# Altium project OFP_MCM_v1.6.3.PrjPcb (part 3 of 7)
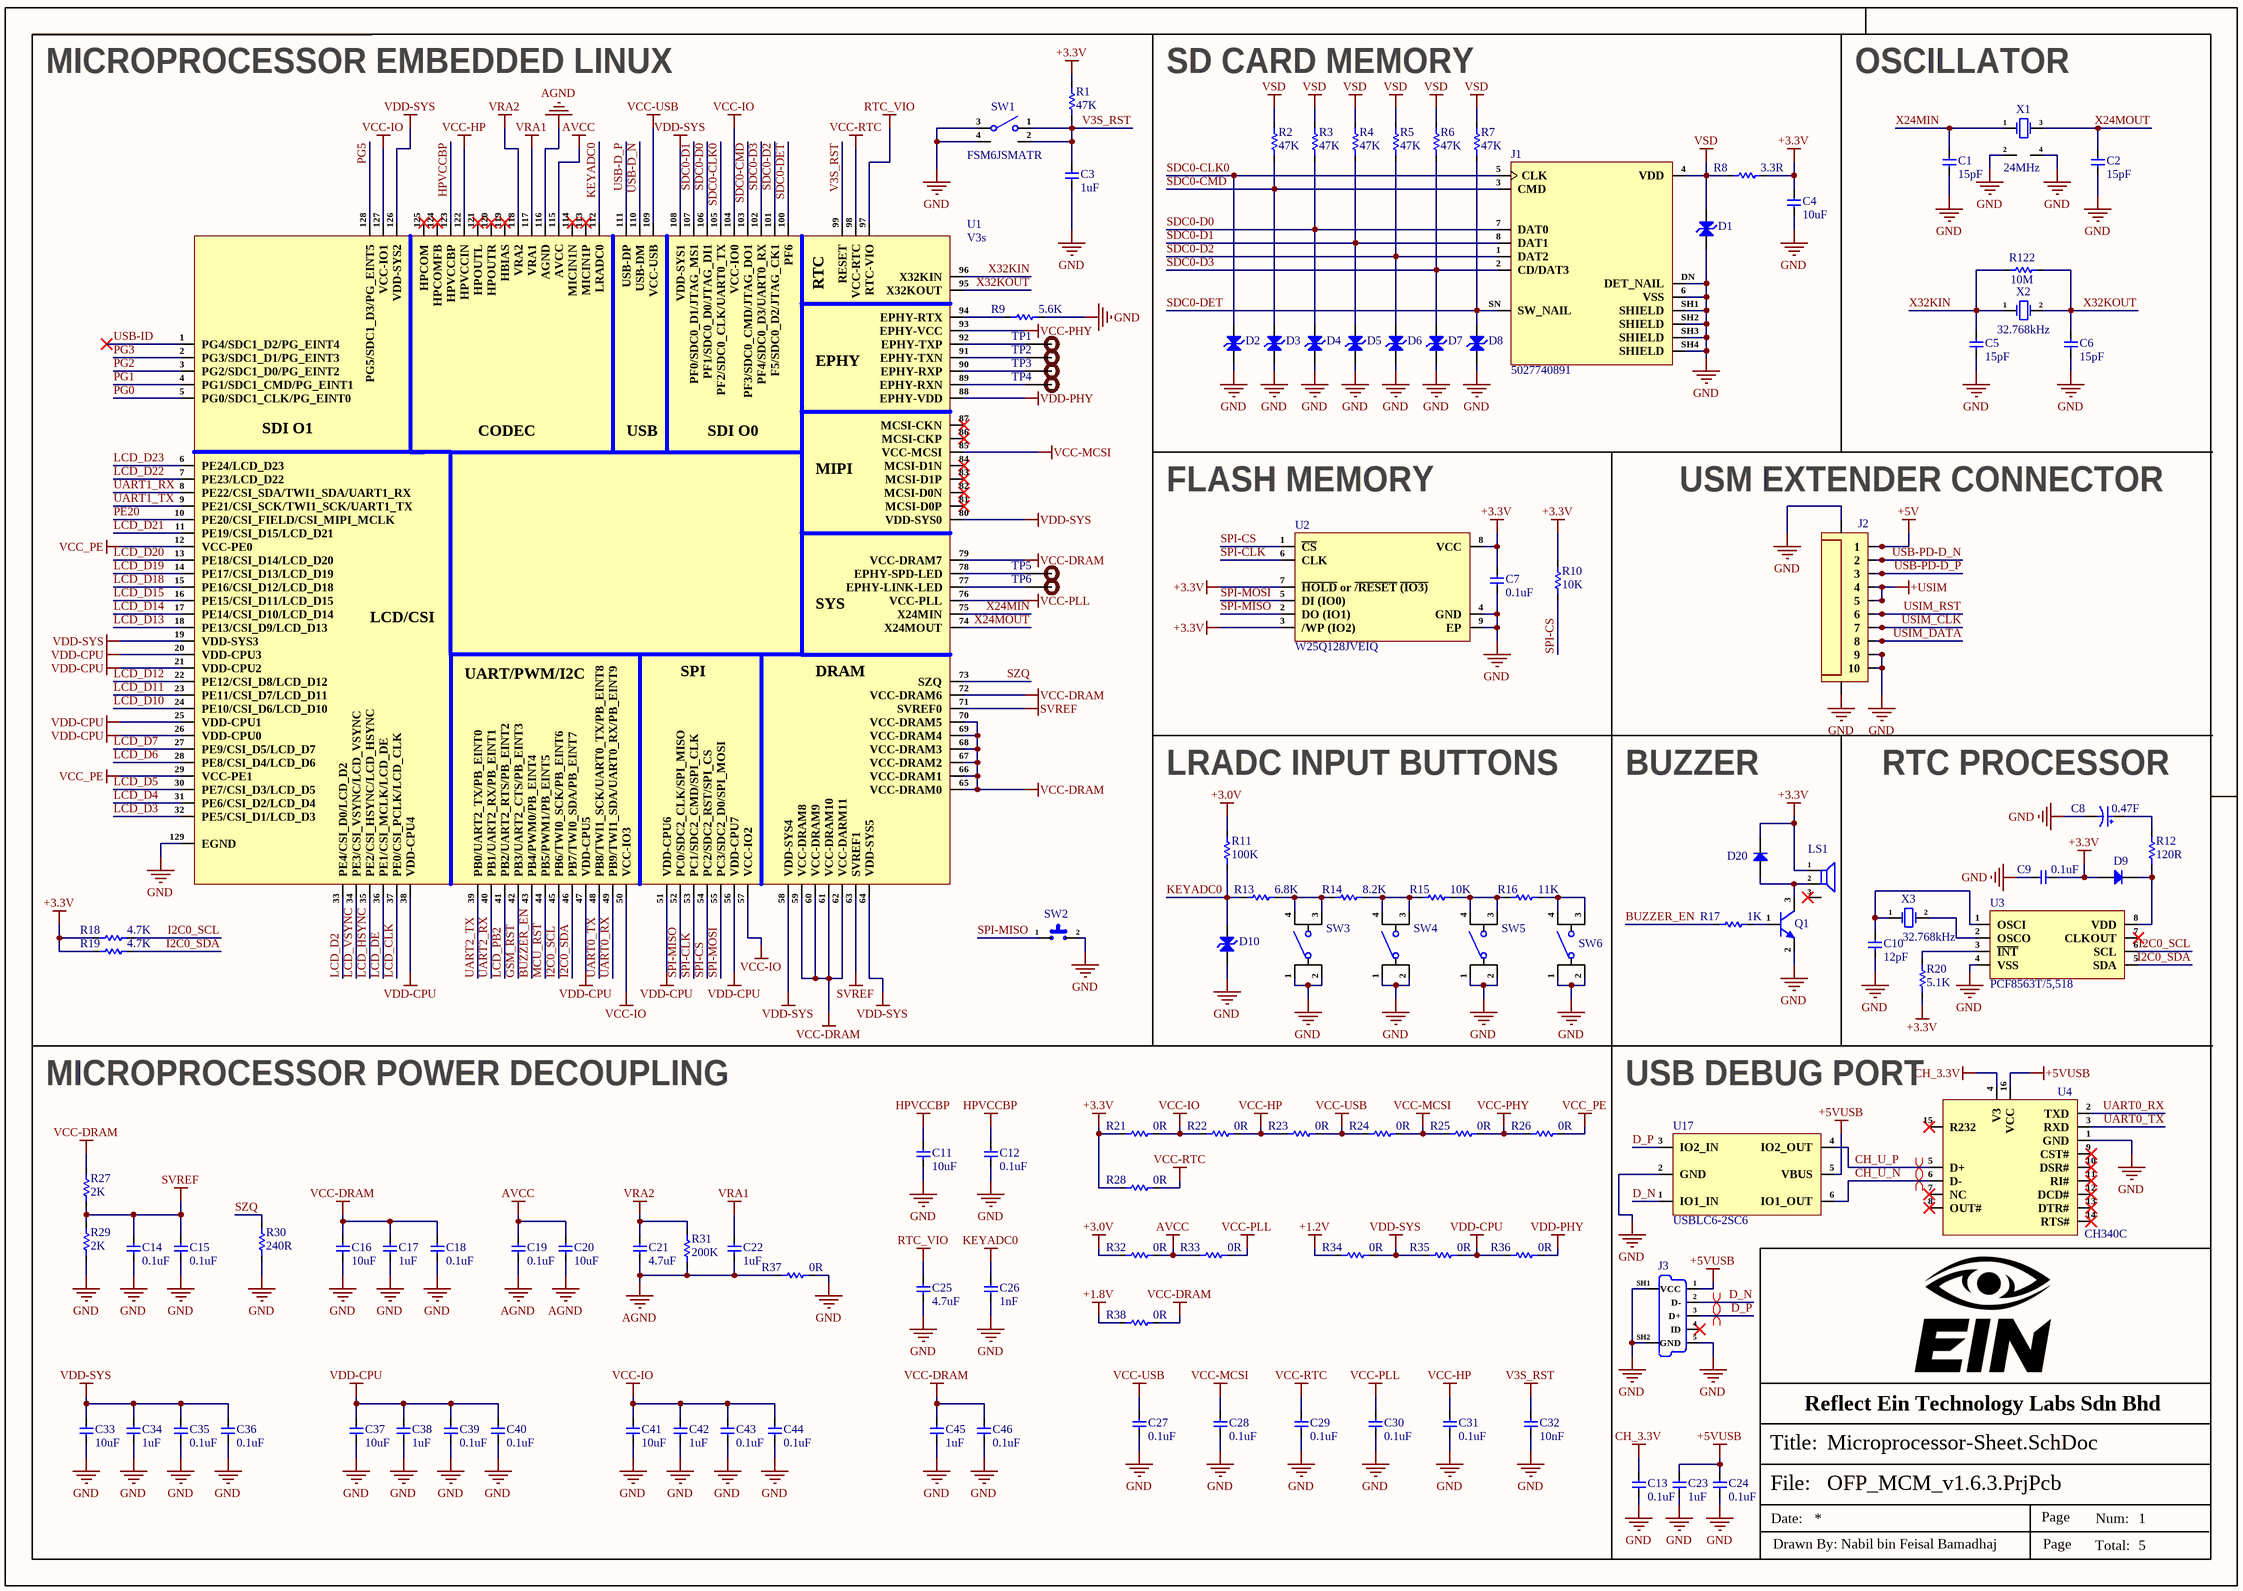
[diagram p6: Microprocessor-Sheet.SchDoc]

## Sheet Microprocessor-Sheet.SchDoc (continued)

### Library data of the parts (continued)
R27 R29 = RC0402FR-072KL: RES 2K OHM 1% 1/16W 0402; Manufacturer: Yageo; Item Type: Resistor; Value: 2kR; Power Rating: 63mW; Voltage Rating: 50V; Temperature Coefficient: 100ppm/°C; LCSC Part Number: C60488; ComponentLink2URL: https://datasheet.ciiva.com/11808/0900766b80c66297-11808787.pdf?src-supplier=Rs; ComponentLink2Description: https://datasheet.ciiva.com/11808/0900766b80c66297-11808787.pdf?src-supplier=Rs; ComponentLink3URL: https://datasheet.ciiva.com/7849/1018594-7849934.pdf?src-supplier=Element14; ComponentLink3Description: https://datasheet.ciiva.com/7849/1018594-7849934.pdf?src-supplier=Element14; ComponentLink4URL: https://datasheet.ciiva.com/7849/1018594-7849935.pdf?src-supplier=Element14; ComponentLink4Description: https://datasheet.ciiva.com/7849/1018594-7849935.pdf?src-supplier=Element14; ComponentLink5URL: https://datasheet.ciiva.com/7983/1018594-7983517.pdf?src-supplier=Element14; ComponentLink5Description: https://datasheet.ciiva.com/7983/1018594-7983517.pdf?src-supplier=Element14; ComponentLink6URL: https://datasheet.ciiva.com/2453/pyu-r-int-thick-7-2453635.pdf?src-supplier=Digi-Key; ComponentLink6Description: https://datasheet.ciiva.com/2453/pyu-r-int-thick-7-2453635.pdf?src-supplier=Digi-Key; ComponentLink7URL: https://datasheet.ciiva.com/2453/pyu-r-int-thick-7-2453636.pdf?src-supplier=Digi-Key; ComponentLink7Description: https://datasheet.ciiva.com/2453/pyu-r-int-thick-7-2453636.pdf?src-supplier=Digi-Key; ComponentLink8URL: https://datasheet.ciiva.com/2453/pyu-r-int-thick-7-2453634.pdf?src-supplier=Digi-Key; ComponentLink8Description: https://datasheet.ciiva.com/2453/pyu-r-int-thick-7-2453634.pdf?src-supplier=Digi-Key; ComponentLink9URL: https://datasheet.ciiva.com/12667/pyu-rc0402-51-rohs-l-6-r-12667451.pdf?src-supplier=Mouser; ComponentLink9Description: https://datasheet.ciiva.com/12667/pyu-rc0402-51-rohs-l-6-r-12667451.pdf?src-supplier=Mouser; ComponentLink10URL: https://datasheet.ciiva.com/15189/getdatasheetpartid-358921-15189414.pdf?src-supplier=Verical; ComponentLink10Description: https://datasheet.ciiva.com/15189/getdatasheetpartid-358921-15189414.pdf?src-supplier=Verical; Supplier: Future Electronics; Supplier Part Number: 7970452; Manufacturer Part Number: RC0402FR-072KL; RoHS: Yes; Category: Chip SMD Resistors; Stock: 8530000; Pricing: 10000=0.0018, 100000=0.0011, 200000=0.0017, 300000=0.001, 750000=0.0016, 2000000=0.0009, 2500000=0.0016, 10000000=0.0014 (USD); Case/Package: 0402; Case Code (Metric): 1005; Case Code (Imperial): 0402; Min Operating Temperature: -55°C; Max Operating Temperature: 155°C; Resistor Type: Thick Film; Tolerance: 1%; Package Quantity: 1; Packaging: Tape and Reel; Number of Terminations: 2; Termination: SMD/SMT; Max Power Dissipation: 63mW; Working Voltage: 50V; Features: Moisture Resistant; Series: RC; Technology: THICK FILM; Construction: Rectangular; Resistance Tolerance: 1%; Voltage Rating (DC): 50V; Length: 0.039inch; Width: 0.02inch; Height: 0.016inch; Depth: 0.5mm; RoHS Compliant: Yes; Military Standard: Not; Reach SVHC Compliant: Unknown; Lead Free: 5697LeadFree; ComponentLink1URL: https://datasheet.ciiva.com/11808/0900766b80c66297-11808787.pdf?src-supplier=Rs; ComponentLink1Description: https://datasheet.ciiva.com/11808/0900766b80c66297-11808787.pdf?src-supplier=Rs; ComponentLink11URL: https://datasheet.ciiva.com/2453/pyu-r-int-thick-7-2453635.pdf?src-supplier=Digikey; ComponentLink11Description: https://datasheet.ciiva.com/2453/pyu-r-int-thick-7-2453635.pdf?src-supplier=Digikey; ComponentLink12URL: https://datasheet.ciiva.com/2453/pyu-r-int-thick-7-2453636.pdf?src-supplier=Digikey; ComponentLink12Description: https://datasheet.ciiva.com/2453/pyu-r-int-thick-7-2453636.pdf?src-supplier=Digikey; ComponentLink13URL: https://datasheet.ciiva.com/2453/pyu-r-int-thick-7-2453634.pdf?src-supplier=Digikey; ComponentLink13Description: https://datasheet.ciiva.com/2453/pyu-r-int-thick-7-2453634.pdf?src-supplier=Digikey
R30 = RC0402FR-07240RL: RES 240 OHM 1% 1/16W 0402; Manufacturer: Yageo; Item Type: Resistors; Power Rating: 63mW; Temperature Coefficient: 100ppm/°C; Voltage Rating (DC): 50V; Supplier 1: Mouser; Manufacturer Part Number: RC0402FR-07240RL; RoHS: Yes; Stock 1: 1903202; Pricing 1: 1=0.10000, 10=0.01200, 50=0.01200, 100=0.00500, 1000=0.00300, 10000=0.00100 (USD); Case/Package: 0402; Case Code (Metric): 1005; Case Code (Imperial): 0402; Size Code: 0402; Min Operating Temperature: -55°C; Max Operating Temperature: 155°C; Resistance: 240R; Tolerance: 1%; Packaging: Tape and Reel; Resistor Type: Thick Film; Voltage Rating: 50V; Package Quantity: 1; Number of Terminations: 2; Termination: SMD/SMT; Max Power Dissipation: 63mW; Features: Moisture Resistant; Series: RC; Construction: Rectangular; Resistance Tolerance: 1%; Length: 1mm; Width: 0.02inch; Height: 0.016inch; Depth: 0.5mm; REACH SVHC: Unknown; Lead Free: Lead Free; RoHS Compliant: Yes; Military Standard: Not; ComponentLink1URL: https://datasheet.ciiva.com/7849/1018594-7849915.pdf?src-supplier=Element14; ComponentLink1Description: https://datasheet.ciiva.com/7849/1018594-7849915.pdf?src-supplier=Element14; ComponentLink2URL: https://datasheet.ciiva.com/7849/1018594-7849916.pdf?src-supplier=Element14; ComponentLink2Description: https://datasheet.ciiva.com/7849/1018594-7849916.pdf?src-supplier=Element14; ComponentLink3URL: https://datasheet.ciiva.com/2519/pyu-r-int-thick-7-2519157.pdf?src-supplier=Digi-Key; ComponentLink3Description: https://datasheet.ciiva.com/2519/pyu-r-int-thick-7-2519157.pdf?src-supplier=Digi-Key; ComponentLink4URL: https://datasheet.ciiva.com/2519/pyu-r-int-thick-7-2519158.pdf?src-supplier=Digi-Key; ComponentLink4Description: https://datasheet.ciiva.com/2519/pyu-r-int-thick-7-2519158.pdf?src-supplier=Digi-Key; ComponentLink5URL: https://datasheet.ciiva.com/2519/pyu-r-int-thick-7-2519156.pdf?src-supplier=Digi-Key; ComponentLink5Description: https://datasheet.ciiva.com/2519/pyu-r-int-thick-7-2519156.pdf?src-supplier=Digi-Key; ComponentLink6URL: https://datasheet.ciiva.com/12669/pyu-rc0402-51-rohs-l-6-r-12669689.pdf?src-supplier=Mouser; ComponentLink6Description: https://datasheet.ciiva.com/12669/pyu-rc0402-51-rohs-l-6-r-12669689.pdf?src-supplier=Mouser; ComponentLink7URL: https://datasheet.ciiva.com/17419/pyu-rc0402-51-rohs-l-6-r-17419482.pdf?src-supplier=Future+Electronics; ComponentLink7Description: https://datasheet.ciiva.com/17419/pyu-rc0402-51-rohs-l-6-r-17419482.pdf?src-supplier=Future+Electronics; Supplier Part Number 1: 603-RC0402FR-07240RL; LCSC Part Number: C114755
R31 = RC0402FR-07200KL: RES 200K OHM 1% 1/16W 0402; Manufacturer: Yageo; Item Type: Resistor; Power Rating: 63mW; Temperature Coefficient: 100ppm/°C; Value: 200kR; Voltage Rating: 50V; Supplier: Future Electronics; LCSC Part Number: C114763; Manufacturer Part Number: RC0402FR-07200KL; RoHS: Yes; Stock: 290000; Pricing: 10000=0.0004, 50000=0.0008, 150000=0.0004, 300000=0.0007, 400000=0.0004, 1000000=0.0004, 2500000=0.0004, 3000000=0.0006 (USD); Case/Package: 0402; Case Code (Metric): 1005; Case Code (Imperial): 0402; Min Operating Temperature: -55°C; Max Operating Temperature: 155°C; Tolerance: 1%; Packaging: Tape and Reel; Termination: SMD/SMT; Series: RC; Technology: THICK FILM; Package Quantity: 1; Resistor Type: Thick Film; Number of Terminations: 2; Max Power Dissipation: 63mW; Working Voltage: 50V; Features: Moisture Resistant; Construction: Rectangular; Resistance Tolerance: 1%; Voltage Rating (DC): 50V; Length: 0.039inch; Width: 0.02inch; Height: 0.016inch; Depth: 0.5mm; RoHS Compliant: Yes; Lead Free: 5697LeadFree; Military Standard: Not; Reach SVHC Compliant: Unknown; ComponentLink1URL: https://datasheet.ciiva.com/7849/1018594-7849897.pdf?src-supplier=Element14; ComponentLink1Description: https://datasheet.ciiva.com/7849/1018594-7849897.pdf?src-supplier=Element14; ComponentLink2URL: https://datasheet.ciiva.com/7849/1018594-7849896.pdf?src-supplier=Element14; ComponentLink2Description: https://datasheet.ciiva.com/7849/1018594-7849896.pdf?src-supplier=Element14; ComponentLink3URL: https://datasheet.ciiva.com/46394/1018594-46394953.pdf?src-supplier=Element14; ComponentLink3Description: https://datasheet.ciiva.com/46394/1018594-46394953.pdf?src-supplier=Element14; ComponentLink4URL: https://datasheet.ciiva.com/2453/pyu-r-int-thick-7-2453557.pdf?src-supplier=Digikey; ComponentLink4Description: https://datasheet.ciiva.com/2453/pyu-r-int-thick-7-2453557.pdf?src-supplier=Digikey; ComponentLink5URL: https://datasheet.ciiva.com/2453/pyu-r-int-thick-7-2453558.pdf?src-supplier=Digikey; ComponentLink5Description: https://datasheet.ciiva.com/2453/pyu-r-int-thick-7-2453558.pdf?src-supplier=Digikey; ComponentLink6URL: https://datasheet.ciiva.com/2453/pyu-r-int-thick-7-2453556.pdf?src-supplier=Digikey; ComponentLink6Description: https://datasheet.ciiva.com/2453/pyu-r-int-thick-7-2453556.pdf?src-supplier=Digikey; ComponentLink7URL: https://datasheet.ciiva.com/12667/pyu-rc0402-51-rohs-l-6-r-12667911.pdf?src-supplier=Mouser; ComponentLink7Description: https://datasheet.ciiva.com/12667/pyu-rc0402-51-rohs-l-6-r-12667911.pdf?src-supplier=Mouser; ComponentLink8URL: https://datasheet.ciiva.com/15189/getdatasheetpartid-323720-15189381.pdf?src-supplier=Verical; ComponentLink8Description: https://datasheet.ciiva.com/15189/getdatasheetpartid-323720-15189381.pdf?src-supplier=Verical; ComponentLink9URL: https://datasheet.ciiva.com/16740/pyu-rc0402-51-rohs-l-6-r-16740636.pdf?src-supplier=Future+Electronics; ComponentLink9Description: https://datasheet.ciiva.com/16740/pyu-rc0402-51-rohs-l-6-r-16740636.pdf?src-supplier=Future+Electronics
R122 = RC0402JR-0710ML: RES SMD 10M Ohm 5% 1/16W 0402; Manufacturer: Yageo; Resistance: 10MR; Power Rating: 62.5mW; Voltage Rating: 50V; Temperature Coefficient: 100ppm/°C; Max Power Dissipation: 63mW; Supplier 1: Digi-Key; Manufacturer Part Number: RC0402JR-0710ML; RoHS: Yes; Category: Chip SMD Resistors; Stock 1: 38636; Pricing 1: 1=0.10000, 10=0.01300, 100=0.00540, 1000=0.00244, 2500=0.00212, 5000=0.00175 (USD); Case/Package: 0402; Number of Pins: 2; Case Code (Metric): 1005; Case Code (Imperial): 0402; Weight: 2.3E-05oz; Size Code: 0402; Min Operating Temperature: -55°C; Max Operating Temperature: 155°C; Tolerance: 5%; Package Quantity: 1; Packaging: Tape and Reel; Resistor Type: Thick Film; Number of Terminations: 2; Termination: SMD/SMT; Voltage Rating (DC): 50V; Features: Moisture Resistant; Series: RC; Construction: Rectangular; Resistance Tolerance: 5%; Length: 1mm; Width: 0.02inch; Height: 0.016inch; Depth: 0.5mm; RoHS Compliant: Yes; REACH SVHC: No SVHC; Military Standard: Not; Lead Free: Lead Free; ComponentLink1URL: https://datasheet.ciiva.com/7983/1018594-7983541.pdf?src-supplier=Element14; ComponentLink1Description: https://datasheet.ciiva.com/7983/1018594-7983541.pdf?src-supplier=Element14; ComponentLink2URL: https://datasheet.ciiva.com/2518/pyu-r-int-thick-7-2518904.pdf?src-supplier=Digi-Key; ComponentLink2Description: https://datasheet.ciiva.com/2518/pyu-r-int-thick-7-2518904.pdf?src-supplier=Digi-Key; ComponentLink3URL: https://datasheet.ciiva.com/2518/pyu-r-int-thick-7-2518905.pdf?src-supplier=Digi-Key; ComponentLink3Description: https://datasheet.ciiva.com/2518/pyu-r-int-thick-7-2518905.pdf?src-supplier=Digi-Key; ComponentLink4URL: https://datasheet.ciiva.com/2518/pyu-r-int-thick-7-2518906.pdf?src-supplier=Digi-Key; ComponentLink4Description: https://datasheet.ciiva.com/2518/pyu-r-int-thick-7-2518906.pdf?src-supplier=Digi-Key; ComponentLink5URL: https://datasheet.ciiva.com/12577/pyu-rc0402-51-rohs-l-6-r-12577774.pdf?src-supplier=Mouser; ComponentLink5Description: https://datasheet.ciiva.com/12577/pyu-rc0402-51-rohs-l-6-r-12577774.pdf?src-supplier=Mouser; Supplier Part Number 1: 311-10MJRCT-ND; LCSC Part Number: C274900
SW1 = FSM6JSMATR: SWITCH TACTILE SPST-NO 0.05A 24V; Manufacturer: TE Connectivity Alcoswitch; Item Type: Switches; Number of Positions: 2NUMBER; Supplier: Rs; LCSC Part Number: C6558197; Manufacturer Part Number: FSM6JSMATR; RoHS: Yes; Stock: 735; RoHS Compliant: 5897YesNo; ComponentLink1URL: https://datasheet.ciiva.com/7097/1486952-7097325.pdf?src-supplier=Newark; ComponentLink1Description: https://datasheet.ciiva.com/7097/1486952-7097325.pdf?src-supplier=Newark; ComponentLink2URL: https://datasheet.ciiva.com/1530/1714712-1530976.pdf?src-supplier=Element14; ComponentLink2Description: https://datasheet.ciiva.com/1530/1714712-1530976.pdf?src-supplier=Element14; ComponentLink3URL: https://datasheet.ciiva.com/15184/getdatasheetpartid-167889-15184443.pdf?src-supplier=Verical; ComponentLink3Description: https://datasheet.ciiva.com/15184/getdatasheetpartid-167889-15184443.pdf?src-supplier=Verical; ComponentLink4URL: https://datasheet.ciiva.com/8082/eng-cs-1308111-1-switches-core-program-catalog-0308-8082682.pdf?src-supplier=Avnet; ComponentLink4Description: https://datasheet.ciiva.com/8082/eng-cs-1308111-1-switches-core-program-catalog-0308-8082682.pdf?src-supplier=Avnet
SW2 = TS-1088-AR02016: Without bracket 50mA 4mm 100000 Times 12V 160gf 3mm 2mm Round Button Standing paste SPST SMD Tactile Switches ROHS; Manufacturer: XUNPU; Manufacturer Part Number: TS-1088-AR02016; Package: SMD; LCSC Part Number: C720477; Item Type: Tactile Switch; ComponentLink1Description: LCSC; ComponentLink1URL: https://www.lcsc.com/product-detail/Tactile-Switches_XUNPU-TS-1088-AR02016_C720477.html?s_z=n_TS-1088-AR02016
SW3-SW6 = TS-1002S-12026C: 6mm 12mm Round Button 50mA Standing paste 6mm SPST 12V SMD,6x6mm Tactile Switches ROHS; Manufacturer: XUNPU; Manufacturer Part Number: TS-1002S-12026C; Package: SMD,6x6mm; LCSC Part Number: C455124; Item Type: Tactile Switch; ComponentLink1Description: LCSC; ComponentLink1URL: https://www.lcsc.com/product-detail/Tactile-Switches_XUNPU-TS-1002S-12026C_C455124.html?s_z=n_TS-1002S-12026C
TP1-TP6 = TEST POINT 0.5mm Dia: Test Point ON; Item Type: Test Point; Manufacturer Part Number: TEST POINT 0.5mm Dia
U1 = V3s: LQFP-128-EP(14x14) Microcontrollers (MCU/MPU/SOC) ROHS; Manufacturer: Allwinner Tech; Item Type: IC; Manufacturer Part Number: V3s; Package: LQFP-128-EP(14x14); LCSC Part Number: C2687449; ComponentLink1Description: LCSC; ComponentLink1URL: https://www.lcsc.com/product-detail/Microcontrollers-MCU-MPU-SOC_Allwinner-Tech-V3s_C2687449.html?s_z=n_V3s
U2 = W25Q128JVEIQ: IC FLASH 128MBIT SPI/QUAD 8WSON; Manufacturer: Winbond; Memory Format: Non-Volatile,FLASH; Memory Size: 128Mb; Frequency: 133MHz; Supplier: Digikey; LCSC Part Number: C401662; Manufacturer Part Number: W25Q128JVEIQ; RoHS: Yes; Item Type: IC; Stock: 12733; Pricing: 1=1.92, 10=1.701, 25=1.6224, 63=1.54651, 126=1.49183, 252=1.43909, 504=1.38821, 1008=1.33908, 5040=1.23141 (USD); Mounting Technology: Surface Mount; Min Operating Temperature: -40°C; Max Operating Temperature: 85°C; Packaging: Rail/Tube; Series: SpiFlash®; RoHS Compliant: Yes; ComponentLink1URL: http://www.winbond.com/resource-files/w25q128jv%20revf%2003272018%20plus.pdf?src-supplier=Digikey; ComponentLink1Description: http://www.winbond.com/resource-files/w25q128jv%20revf%2003272018%20plus.pdf?src-supplier=Digikey
U3 = PCF8563T/5,518: IC RTC CLOCK/CALENDAR I2C 8SO; Manufacturer: NXP Semiconductors; Supplier: Arrow Electronics; LCSC Part Number: C7440; Manufacturer Part Number: PCF8563T/5,518; RoHS: Yes; Item Type: IC; Stock: 812; Pricing: 1=0.8372, 10=0.6546, 100=0.5322, 500=0.5102, 1000=0.4872, 2500=0.4562, 5000=0.4356, 10000=0.4016, 25000=0.3863 (USD); ComponentLink1URL: https://datasheet.ciiva.com/8145/pcf8563-8145180.pdf?src-supplier=Avnet; ComponentLink1Description: https://datasheet.ciiva.com/8145/pcf8563-8145180.pdf?src-supplier=Avnet; ComponentLink2URL: https://datasheet.ciiva.com/1238/pcf8563-1238727.pdf?src-supplier=Digikey; ComponentLink2Description: https://datasheet.ciiva.com/1238/pcf8563-1238727.pdf?src-supplier=Digikey; ComponentLink3URL: https://datasheet.ciiva.com/1238/pcf8563-1238728.pdf?src-supplier=Digikey; ComponentLink3Description: https://datasheet.ciiva.com/1238/pcf8563-1238728.pdf?src-supplier=Digikey; ComponentLink4URL: https://datasheet.ciiva.com/1238/pcf8563-1238773.pdf?src-supplier=Digikey; ComponentLink4Description: https://datasheet.ciiva.com/1238/pcf8563-1238773.pdf?src-supplier=Digikey; ComponentLink5URL: https://datasheet.ciiva.com/16287/pcf8563-16287110.pdf?src-supplier=Future+Electronics; ComponentLink5Description: https://datasheet.ciiva.com/16287/pcf8563-16287110.pdf?src-supplier=Future+Electronics
U4 = CH340C: 2Mbps Transceiver USB 2.0 SOP-16 USB ICs ROHS; Manufacturer: WCH; Item Type: IC; Manufacturer Part Number: CH340C; Package: SOP-16; LCSC Part Number: C84681; ComponentLink1Description: LCSC; ComponentLink1URL: https://www.lcsc.com/product-detail/USB-ICs_WCH-Jiangsu-Qin-Heng-CH340C_C84681.html
U17 = USBLC6-2SC6: 6A 12V 150W 6V Unidirectional 5V SOT-23-6 ESD and Surge Protection (TVS/ESD) ROHS; Manufacturer: TECH PUBLIC; Manufacturer Part Number: USBLC6-2SC6; Package: SOT-23-6; LCSC Part Number: C2827654; Item Type: (TVS/ESD); ComponentLink1Description: LCSC; ComponentLink1URL: https://www.lcsc.com/product-detail/ESD-and-Surge-Protection-TVS-ESD_TECH-PUBLIC-USBLC6-2SC6_C2827654.html
X1 = 7M24000192: 24MHz Surface Mount Crystal 12pF ±10ppm ±10ppm SMD3225-4P Crystals ROHS; Manufacturer: TXC Corp; Item Type: Crytal; Manufacturer Part Number: 7M24000192; Package: SMD3225-4P; LCSC Part Number: C331579; ComponentLink1Description: LCSC; ComponentLink1URL: https://www.lcsc.com/product-detail/Crystals_TXC-Corp-7M24000192_C331579.html
X2 X3 = CM315D32768DZFT: CRYSTAL 32.7680KHZ 12.5PF SMD; Manufacturer: Citizen; Item Type: Crystals; Supplier: Digikey; LCSC Part Number: C182057; Manufacturer Part Number: CM315D32768DZFT; RoHS: Yes; Stock: 343217; Pricing: 1=0.5, 10=0.432, 50=0.3892, 100=0.3723, 500=0.3358, 1000=0.32128 (USD); Lead Free: 5697LeadFree; ComponentLink1URL: https://datasheet.ciiva.com/16437/cm315-16437047.pdf?src-supplier=Future+Electronics; ComponentLink1Description: https://datasheet.ciiva.com/16437/cm315-16437047.pdf?src-supplier=Future+Electronics

## Sheet Power-Sheet.SchDoc
size 420 x 297 mm; SheetNumber: 2; SheetTotal: 5
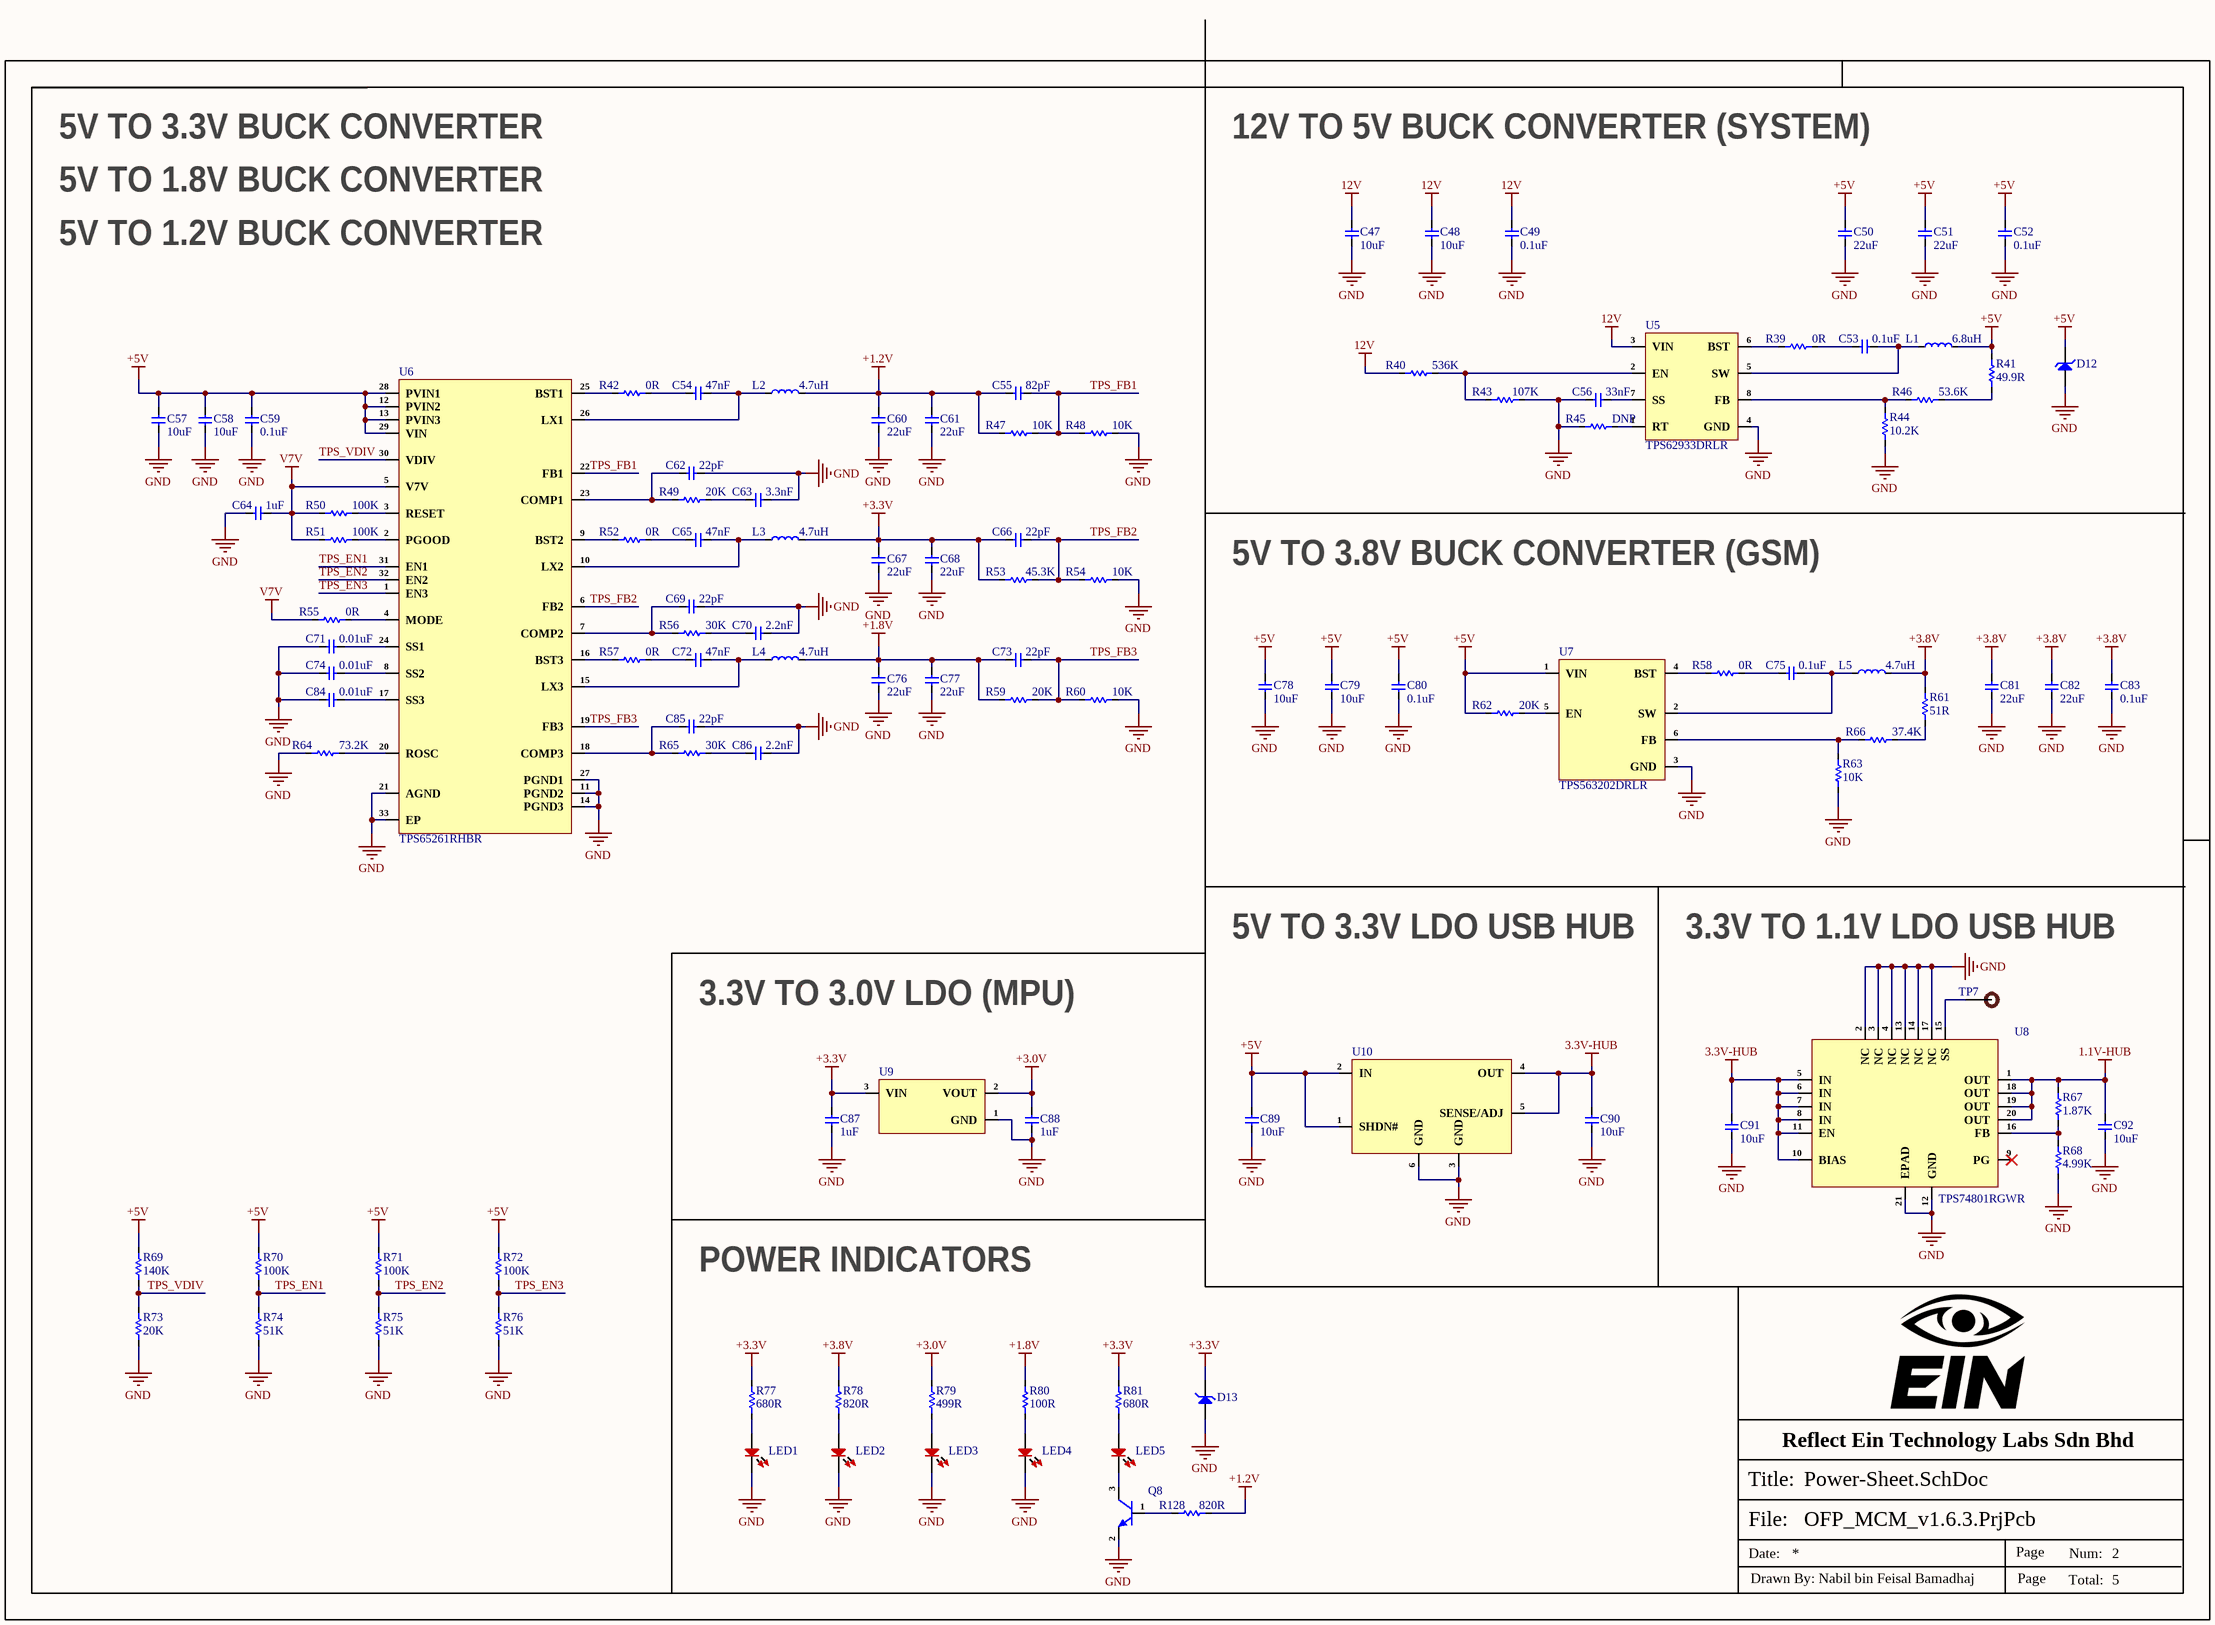
[diagram p1: Power-Sheet.SchDoc]

### Parts
C47  10uF  [Cap-1210]
C48  10uF  [Cap-1210]
C49  0.1uF  [Cap-0603]
C50  22uF  [Cap-0805]
C51  22uF  [Cap-0805]
C52  0.1uF  [Cap-0603]
C53  0.1uF  [Cap-0603]
C54  47nF  [Cap-0603]
C55  82pF  [Cap-0603]
C56  33nF  [Cap-0603]
C57  10uF  [Cap-0603]
C58  10uF  [Cap-0603]
C59  0.1uF  [Cap-0603]
C60  22uF  [Cap-0805]
C61  22uF  [Cap-0805]
C62  22pF  [Cap-0603]
C63  3.3nF  [Cap-0603]
C64  1uF  [Cap-0603]
C65  47nF  [Cap-0603]
C66  22pF  [Cap-0603]
C67  22uF  [Cap-0805]
C68  22uF  [Cap-0805]
C69  22pF  [Cap-0603]
C70  2.2nF  [Cap-0603]
C71  0.01uF  [Cap-0603]
C72  47nF  [Cap-0603]
C73  22pF  [Cap-0603]
C74  0.01uF  [Cap-0603]
C75  0.1uF  [Cap-0603]
C76  22uF  [Cap-0805]
C77  22uF  [Cap-0805]
C78  10uF  [Cap-1210]
C79  10uF  [Cap-1210]
C80  0.1uF  [Cap-0603]
C81  22uF  [Cap-0805]
C82  22uF  [Cap-0805]
C83  0.1uF  [Cap-0603]
C84  0.01uF  [Cap-0603]
C85  22pF  [Cap-0603]
C86  2.2nF  [Cap-0603]
C87  1uF  [Cap-0402]
C88  1uF  [Cap-0402]
C89  10uF  [Cap-1210]
C90  10uF  [Cap-1210]
C91  10uF  [Cap-1210]
C92  10uF  [Cap-1210]
D12  SMBJ5.0A  [SMB_]  (value not drawn)
D13  MSP3V3HM3/89A  [MicroSMP]  (value not drawn)
L1  6.8uH  [ETQP3M6R8KVN]
L2  4.7uH  [YSPI0518S-4R7M]
L3  4.7uH  [YSPI0518S-4R7M]
L4  4.7uH  [YSPI0518S-4R7M]
L5  4.7uH  [SRN4018-4R7M]
LED1  RED  [TH LED 5mm_]  (value not drawn)
LED2  RED  [LED-0603]  (value not drawn)
LED3  RED  [LED-0603]  (value not drawn)
LED4  RED  [LED-0603]  (value not drawn)
LED5  RED  [LED-0603]  (value not drawn)
Q8  MMBT3904  [SOT-23]  (value not drawn)
R39  0R  [Res-0603]
R40  536K  [Res-0603]
R41  49.9R  [Res-0603]
R42  0R  [Res-0603]
R43  107K  [Res-0603]
R44  10.2K  [Res-0603]
R45  DNP  [Res-0603]
R46  53.6K  [Res-0603]
R47  10K  [Res-0603]
R48  10K  [Res-0603]
R49  20K  [Res-0603]
R50  100K  [Res-0603]
R51  100K  [Res-0603]
R52  0R  [Res-0603]
R53  45.3K  [Res-0603]
R54  10K  [Res-0603]
R55  0R  [Res-0603]
R56  30K  [Res-0603]
R57  0R  [Res-0603]
R58  0R  [Res-0603]
R59  20K  [Res-0603]
R60  10K  [Res-0603]
R61  51R  [Res-0603]
R62  20K  [Res-0603]
R63  10K  [Res-0603]
R64  73.2K  [Res-0603]
R65  30K  [Res-0603]
R66  37.4K  [Res-0603]
R67  1.87K  [Res-0402]
R68  4.99K  [Res-0402]
R69  140K  [Res-0603]
R70  100K  [Res-0603]
R71  100K  [Res-0603]
R72  100K  [Res-0603]
R73  20K  [Res-0603]
R74  51K  [Res-0603]
R75  51K  [Res-0603]
R76  51K  [Res-0603]
R77  680R  [Res-0603]
R78  820R  [Res-0603]
R79  499R  [Res-0603]
R80  100R  [Res-0603]
R81  680R  [Res-0603]
R128  820R  [Res-0603]
TP7  TEST POINT 0.5mm Dia  [Test-point - 0.5mm]  (value not drawn)  (no BOM)
U5  TPS62933DRLR  [SOT-583]
U6  TPS65261RHBR  [32-QFN (5x5)]
U7  TPS563202DRLR  [SOT-563]
U8  TPS74801RGWR  [20-VQFN (5x5)]
U9  XC6206P302MR-G  [SOT-23]  (value not drawn)
U10  TPS7A4533DCQR  [SOT-223-6_]  (value not drawn)

### Nets
1.1V-HUB: C92.2 R67.2 U8.1(OUT) U8.18(OUT) U8.19(OUT) U8.20(OUT)
3.3V-HUB: C90.2 C91.2 U8.5(IN) U8.6(IN) U8.7(IN) U8.8(IN) U8.10(BIAS) U8.11(EN) U10.4(OUT) U10.5(SENSE/ADJ)
12V: C47.2 C48.2 C49.2 R40.1 U5.3(VIN)
+1.2V: C55.1 C60.2 C61.2 L2.2 R47.1 R128.1
+1.8V: C73.1 C76.2 C77.2 L4.2 R59.2 R80.2
+3.0V: C88.2 R79.2 U9.2(VOUT)
+3.3V: C66.1 C67.2 C68.2 C87.2 D13.2(K) L3.2 R53.1 R77.2 R81.2 U9.3(VIN)
+3.8V: C81.2 C82.2 C83.2 L5.2 R61.2 R78.2
+5V: C50.2 C51.2 C52.2 C57.2 C58.2 C59.2 C78.2 C79.2 C80.2 C89.2 D12.2(K) L1.2 R41.2 R62.1 R69.2 R70.2 R71.2 R72.2 U6.12(PVIN2) U6.13(PVIN3) U6.28(PVIN1) U6.29(VIN) U7.1(VIN) U10.1(SHDN#) U10.2(IN)
GND: C47.1 C48.1 C49.1 C50.1 C51.1 C52.1 C56.1 C57.1 C58.1 C59.1 C60.1 C61.1 C62.2 C63.2 C64.1 C67.1 C68.1 C69.2 C70.2 C71.1 C74.1 C76.1 C77.1 C78.1 C79.1 C80.1 C81.1 C82.1 C83.1 C84.1 C85.2 C86.2 C87.1 C88.1 C89.1 C90.1 C91.1 C92.1 D12.1(A) D13.1(A) LED1.1 LED2.2 LED3.2 LED4.2 Q8.2(B) R43.2 R44.1 R45.1 R48.2 R54.2 R60.2 R63.1 R64.1 R68.1 R73.1 R74.1 R75.1 R76.1 U5.4(GND) U6.11(PGND2) U6.14(PGND3) U6.21(AGND) U6.27(PGND1) U6.33(EP) U7.3(GND) U8.2(NC) U8.3(NC) U8.4(NC) U8.12(GND) U8.13(NC) U8.14(NC) U8.17(NC) U8.21(EPAD) U9.1(GND) U10.3(GND) U10.6(GND)
V7V: C64.2 R50.1 R51.1 R55.1 U6.5(V7V)
TPS_EN1: R70.1 R74.2 U6.31(EN1)
TPS_EN2: R71.1 R75.2 U6.32(EN2)
TPS_EN3: R72.1 R76.2 U6.1(EN3)
TPS_FB1: C55.2 R47.2 R48.1 U6.22(FB1)
TPS_FB2: C66.2 R53.2 R54.1 U6.6(FB2)
TPS_FB3: C73.2 R59.1 R60.1 U6.19(FB3)
TPS_VDIV: R69.1 R73.2 U6.30(VDIV)
NetC53_1: C53.1 R39.2
NetC53_2: C53.2 L1.1 U5.5(SW)
NetC54_1: C54.1 R42.2
NetC54_2: C54.2 L2.1 U6.26(LX1)
NetC56_2: C56.2 U5.7(SS)
NetC62_1: C62.1 R49.2 U6.23(COMP1)
NetC63_1: C63.1 R49.1
NetC65_1: C65.1 R52.2
NetC65_2: C65.2 L3.1 U6.10(LX2)
NetC69_1: C69.1 R56.1 U6.7(COMP2)
NetC70_1: C70.1 R56.2
NetC71_2: C71.2 U6.24(SS1)
NetC72_1: C72.1 R57.2
NetC72_2: C72.2 L4.1 U6.15(LX3)
NetC74_2: C74.2 U6.8(SS2)
NetC75_1: C75.1 R58.2
NetC75_2: C75.2 L5.1 U7.2(SW)
NetC84_2: C84.2 U6.17(SS3)
NetC85_1: C85.1 R65.1 U6.18(COMP3)
NetC86_1: C86.1 R65.2
NetLED1_2: LED1.2 R77.1
NetLED2_1: LED2.1 R78.1
NetLED3_1: LED3.1 R79.1
NetLED4_1: LED4.1 R80.1
NetLED5_1: LED5.1 R81.1
NetLED5_2: LED5.2 Q8.3(C)
NetQ8_1: Q8.1(E) R128.2
NetR39_1: R39.1 U5.6(BST)
NetR40_2: R40.2 R43.1 U5.2(EN)
NetR41_1: R41.1 R46.1
NetR42_1: R42.1 U6.25(BST1)
NetR44_2: R44.2 R46.2 U5.8(FB)
NetR45_2: R45.2 U5.1(RT)
NetR50_2: R50.2 U6.3(RESET)
NetR51_2: R51.2 U6.2(PGOOD)
NetR52_1: R52.1 U6.9(BST2)
NetR55_2: R55.2 U6.4(MODE)
NetR57_1: R57.1 U6.16(BST3)
NetR58_1: R58.1 U7.4(BST)
NetR61_1: R61.1 R66.1
NetR62_2: R62.2 U7.5(EN)
NetR63_2: R63.2 R66.2 U7.6(FB)
NetR64_2: R64.2 U6.20(ROSC)
NetR67_1: R67.1 R68.2 U8.16(FB)
NetTP7_1: TP7.1 U8.15(SS)

Not connected (* = marked no-connect by the designer): U8 9(PG)*

### Notes on the sheet
- 5V TO 3.3V BUCK CONVERTER
- 5V TO 1.8V BUCK CONVERTER
- 12V TO 5V BUCK CONVERTER (SYSTEM)
- 5V TO 1.2V BUCK CONVERTER
- 5V TO 3.8V BUCK CONVERTER (GSM)
- 5V TO 3.3V LDO USB HUB
- 3.3V TO 1.1V LDO USB HUB
- 3.3V TO 3.0V LDO (MPU)
- POWER INDICATORS
- Reflect Ein Technology Labs Sdn Bhd
- File:
- Title:
- Date:
- Page
- Num:
- Total:
- Drawn By: Nabil bin Feisal Bamadhaj